# Altium schematic sheet Sheet4.SchDoc
size A1; SheetNumber: 1; SheetTotal: 1
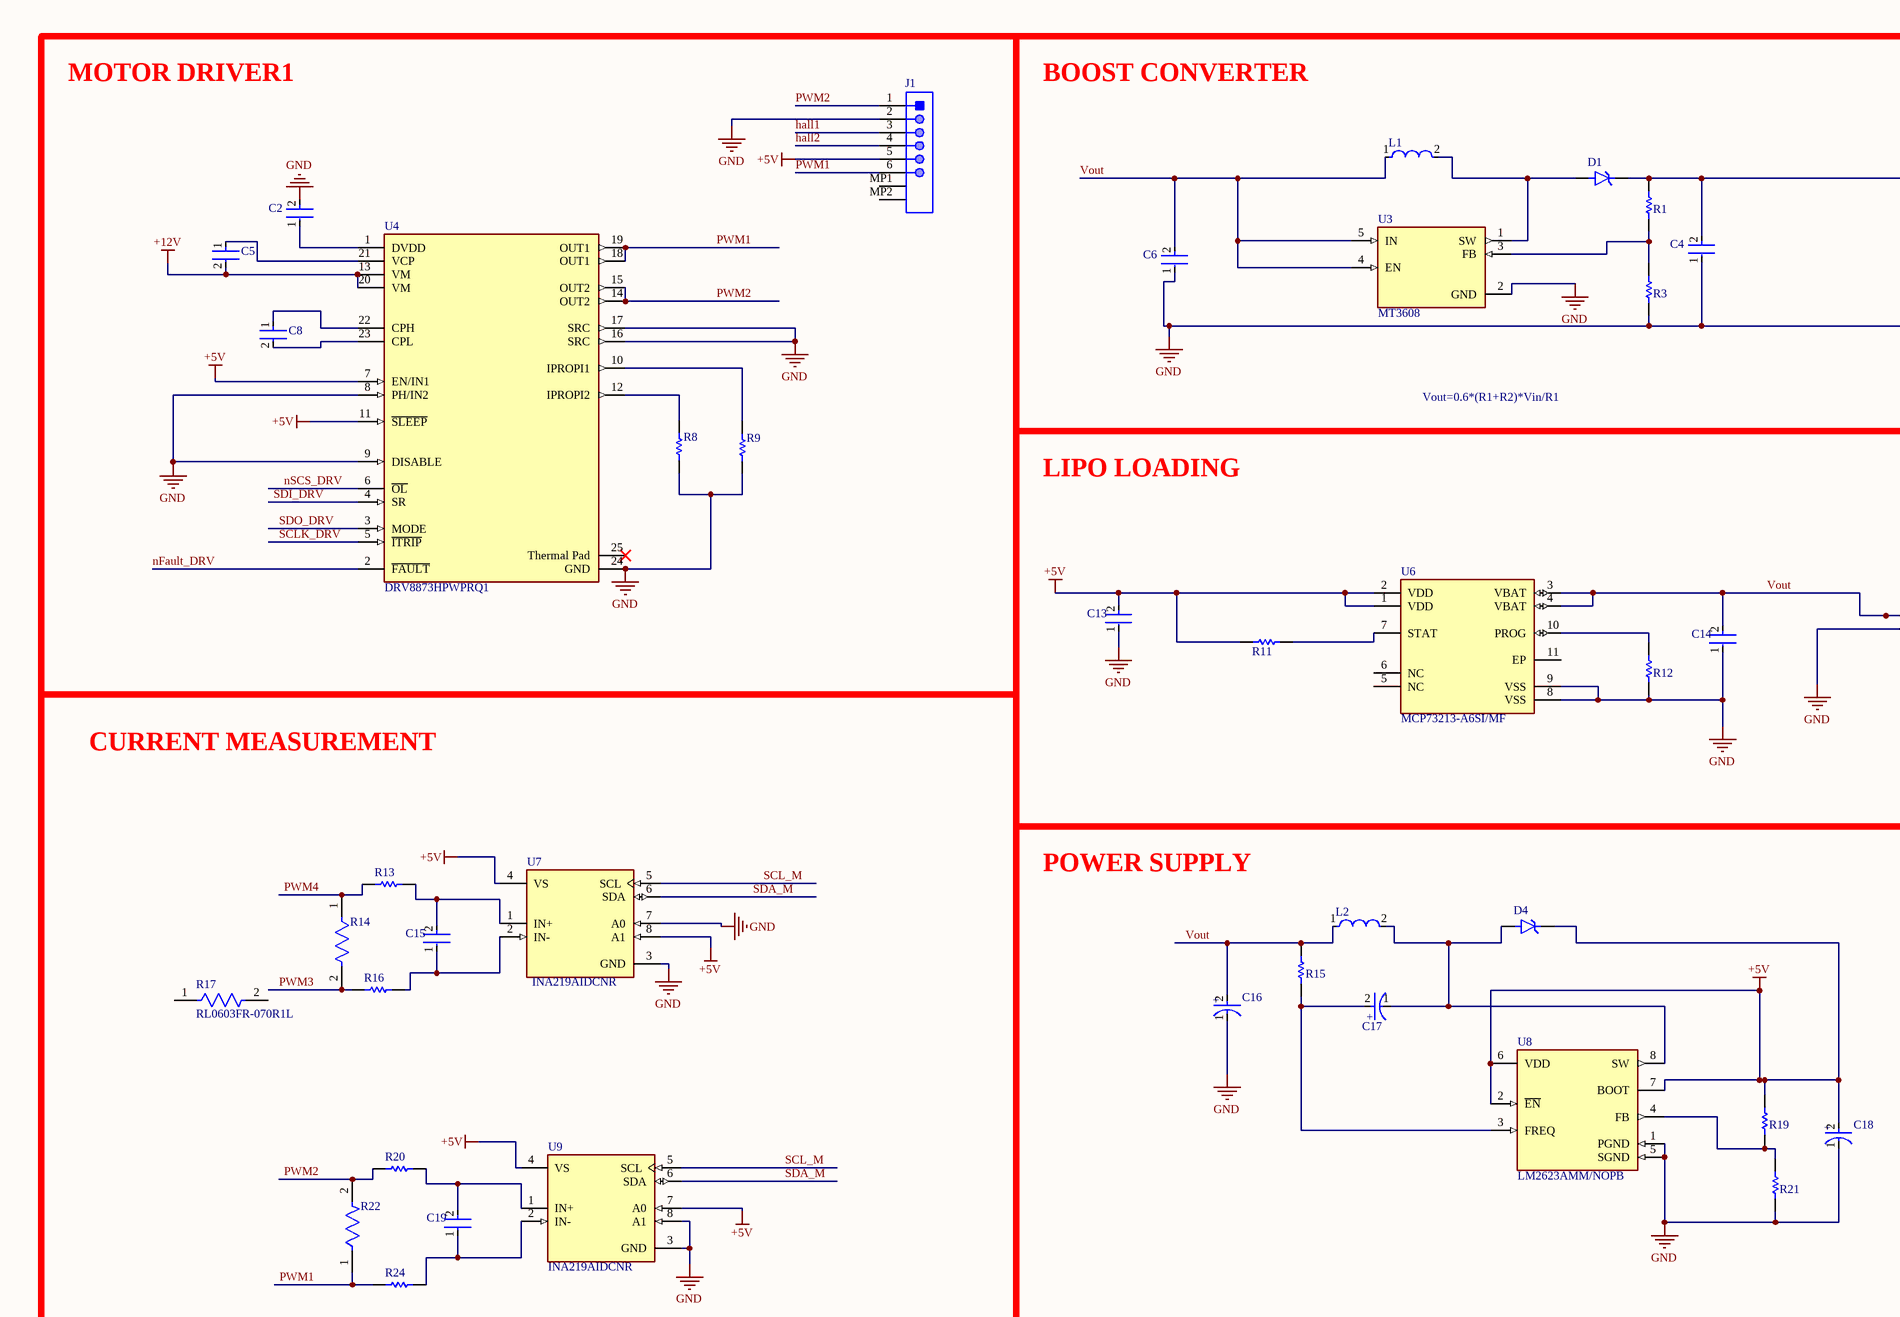
[diagram p0: Sheet4.SchDoc, top left]
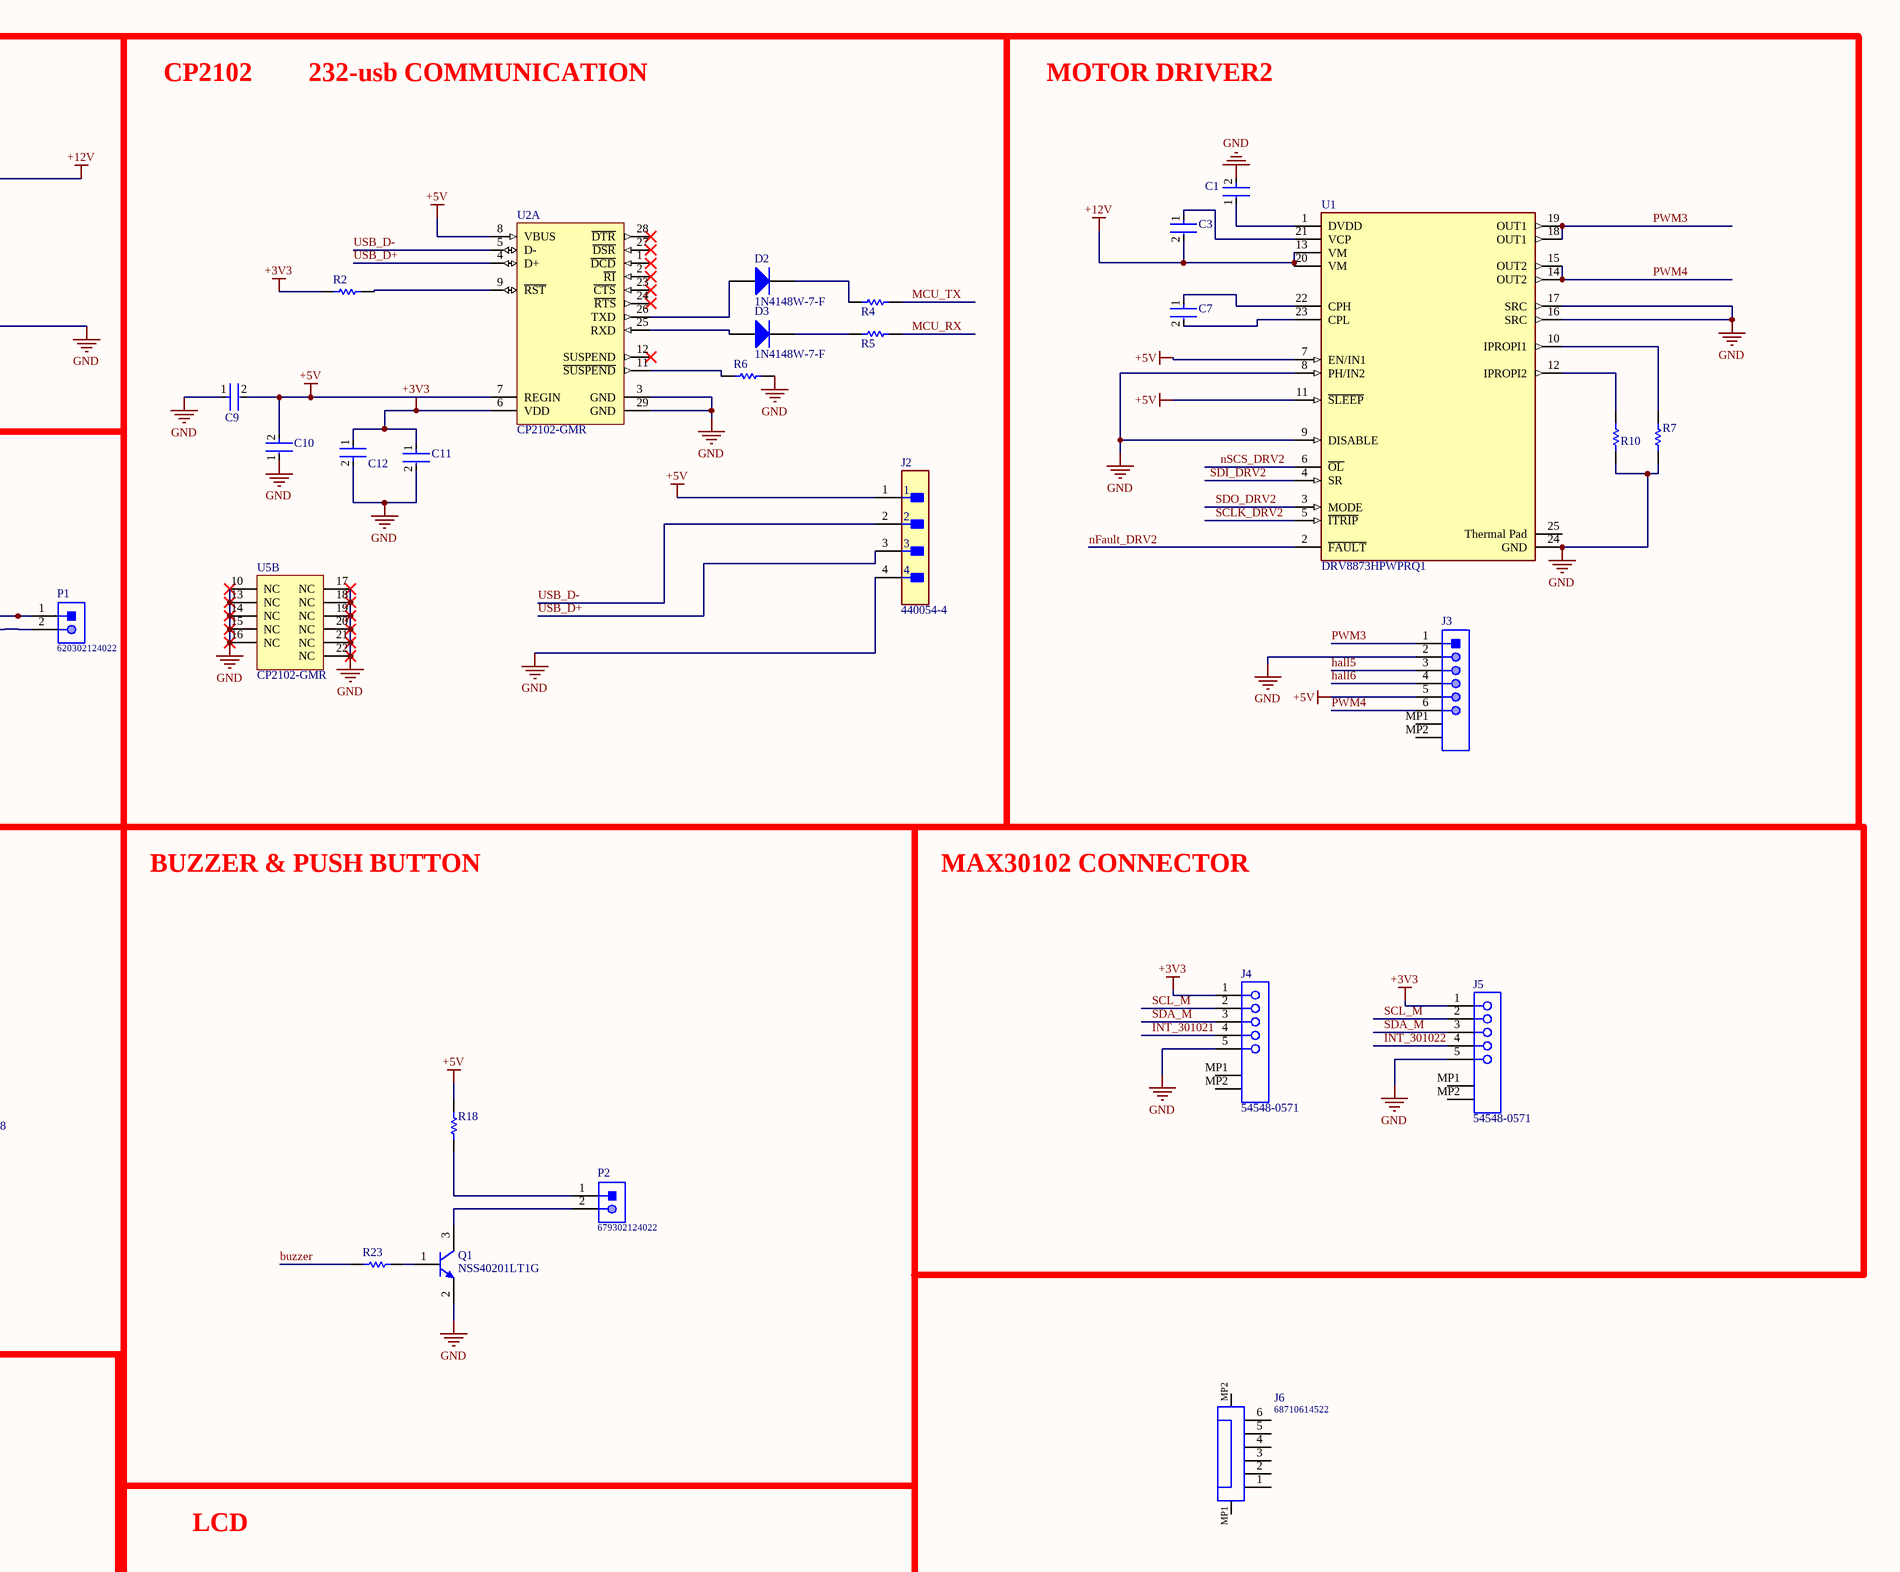
[diagram p1: Sheet4.SchDoc, top right]
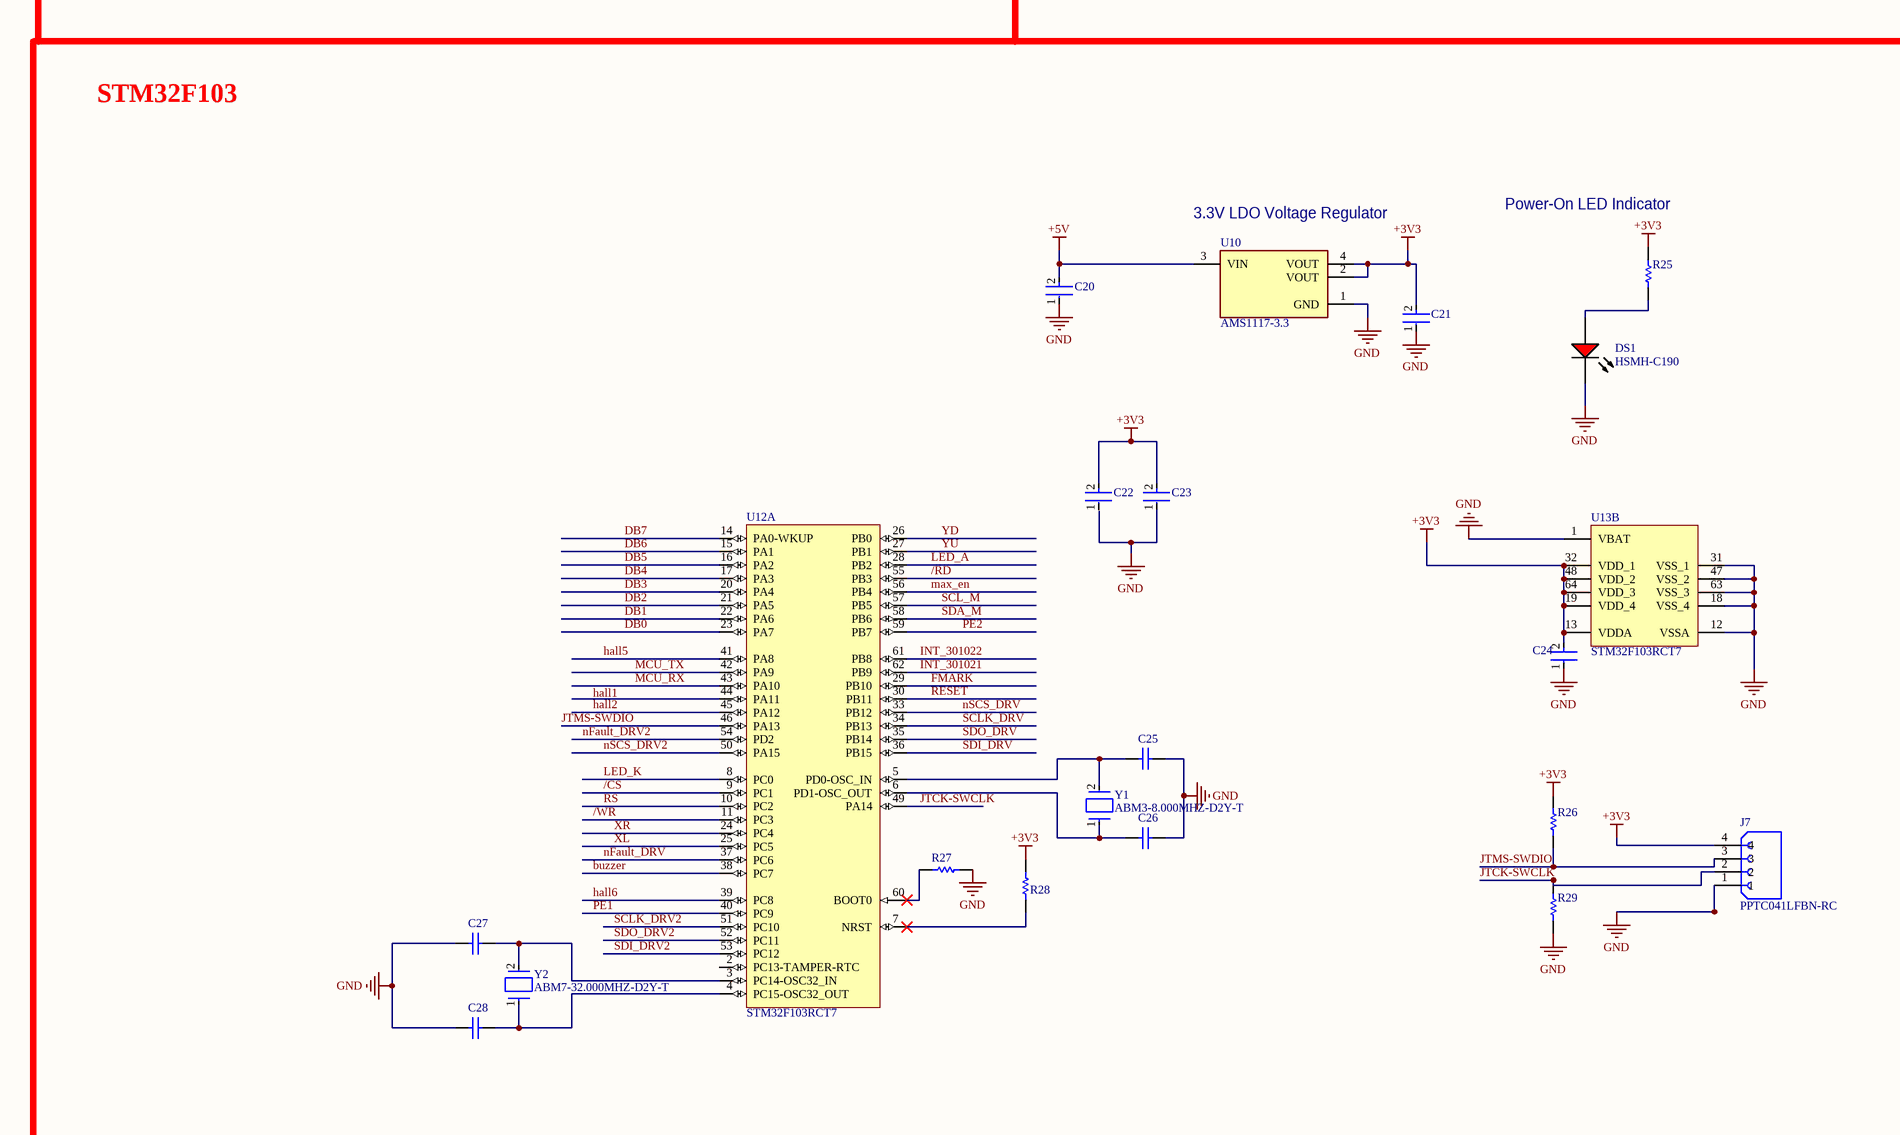
[diagram p2: Sheet4.SchDoc, bottom left]
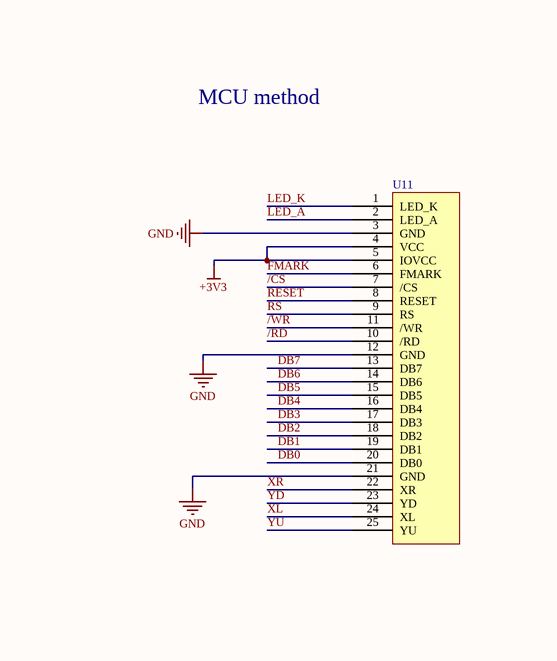
[diagram p3: Sheet4.SchDoc, bottom right]

## Parts
C1  GRM155R71C104KA88D  [FP-GRM15-MFG]  (value not drawn)
C2  GRM155R71C104KA88D  [FP-GRM15-MFG]  (value not drawn)
C3  GRM155R61A105KE15D  [FP-GRM15-0_1-MFG]  (value not drawn)
C4  GRM155R71C104KA88D  [FP-GRM15-MFG]  (value not drawn)
C5  GRM155R61A105KE15D  [FP-GRM15-0_1-MFG]  (value not drawn)
C6  GRM155R71C104KA88D  [FP-GRM15-MFG]  (value not drawn)
C7  GRM155R71E473KA88D  [FP-GRM155-0_05-IPC_C]  (value not drawn)
C8  GRM155R71E473KA88D  [FP-GRM155-0_05-IPC_C]  (value not drawn)
C9  GRM155R71E473KA88D  [FP-GRM155-0_05-IPC_C]  (value not drawn)
C10  GRM155R71C104KA88D  [FP-GRM15-MFG]  (value not drawn)
C11  GRM155R71E473KA88D  [FP-GRM155-0_05-IPC_C]  (value not drawn)
C12  GRM155R71C104KA88D  [FP-GRM15-MFG]  (value not drawn)
C13  GRM155R71C104KA88D  [FP-GRM15-MFG]  (value not drawn)
C14  GRM155R71C104KA88D  [FP-GRM15-MFG]  (value not drawn)
C15  GRM155R71C104KA88D  [FP-GRM15-MFG]  (value not drawn)
C16  TAJB336K010RNJ  [FP-TAJB-MFG]  (value not drawn)
C17  TAJB336K010RNJ  [FP-TAJB-MFG]  (value not drawn)
C18  TAJB336K010RNJ  [FP-TAJB-MFG]  (value not drawn)
C19  GRM155R71C104KA88D  [FP-GRM15-MFG]  (value not drawn)
C20  GRM155R71C104KA88D  [FP-GRM15-MFG]  (value not drawn)
C21  GRM155R71C104KA88D  [FP-GRM15-MFG]  (value not drawn)
C22  GRM155R71C104KA88D  [FP-GRM15-MFG]  (value not drawn)
C23  GRM155R71C104KA88D  [FP-GRM15-MFG]  (value not drawn)
C24  GRM155R71C104KA88D  [FP-GRM15-MFG]  (value not drawn)
C25  CC0402JRNPO9BN220  [CAPC1005X55X25ML05T05]  (value not drawn)
C26  CC0402JRNPO9BN220  [CAPC1005X55X25ML05T05]  (value not drawn)
C27  CC0402JRNPO9BN220  [CAPC1005X55X25ML05T05]  (value not drawn)
C28  CC0402JRNPO9BN220  [CAPC1005X55X25ML05T05]  (value not drawn)
D1  1SMB5918BT3G  [DIOM5226X220N]  (value not drawn)
D2  1N4148W-7-F  [DIOD-SOD123-2_V]
D3  1N4148W-7-F  [DIOD-SOD123-2_V]
D4  1SMB5918BT3G  [DIOM5226X220N]  (value not drawn)
DS1  HSMH-C190  [AVAG-HSMX-C190_V]
J1  S6B-PH-SM4-TB(LF)(SN)  [JST-S6B-PH-SM4-TB(LF)(SN)_V]  (value not drawn)
J2  440054-4  [FP-440054-4-MFG]
J3  S6B-PH-SM4-TB(LF)(SN)  [JST-S6B-PH-SM4-TB(LF)(SN)_V]  (value not drawn)
J4  54548-0571  [MOLX-54548-0571]
J5  54548-0571  [MOLX-54548-0571]
J6  68710614522  [68710614522]
J7  PPTC041LFBN-RC  [SULLINS_PPTC041LFBN-RC]
L1  LB3218T220K  [FP-LB3218-1_8-0_2-IPC_A]  (value not drawn)
L2  LB3218T220K  [FP-LB3218-1_8-0_2-IPC_A]  (value not drawn)
P1  620302124022  [620302124022]
P2  679302124022  [679302124022]
Q1  NSS40201LT1G  [ONSC-SOT-23-3-318-08_V]
R1  RC0402FR-075K1L  [RESC1005X40X25NL05T10]  (value not drawn)
R2  CRCW08055K00FKTA  [RESC2013X50X30NL20T20]  (value not drawn)
R3  RC0603FR-072K7L  [RESC1608X55X25LL10T15]  (value not drawn)
R4  ERJ-3EKF3300V  [RESC1608X55X30ML15T15]  (value not drawn)
R5  ERJ-3EKF3300V  [RESC1608X55X30ML15T15]  (value not drawn)
R6  CRCW08055K00FKTA  [RESC2013X50X30NL20T20]  (value not drawn)
R7  ERJ-3EKF1501V  [RESC1608X55X30ML15T15]  (value not drawn)
R8  ERJ-3EKF1501V  [RESC1608X55X30ML15T15]  (value not drawn)
R9  ERJ-3EKF1501V  [RESC1608X55X30ML15T15]  (value not drawn)
R10  ERJ-3EKF1501V  [RESC1608X55X30ML15T15]  (value not drawn)
R11  MCMR04X300 JTL  [RESC1005X40X25ML05T10]  (value not drawn)
R12  CRCW06036K20JNEA  [RESC1609X50X30LL10T20]  (value not drawn)
R13  TNPW080510R0FEEA  [RESC2013X55X40ML15T20]  (value not drawn)
R14  RL0603FR-070R1L  [FP-RL0603-0_55-MFG]  (value not drawn)
R15  MCMR04X300 JTL  [RESC1005X40X25ML05T10]  (value not drawn)
R16  TNPW080510R0FEEA  [RESC2013X55X40ML15T20]  (value not drawn)
R17  RL0603FR-070R1L  [FP-RL0603-0_55-MFG]
R18  ERJ-3EKF3300V  [RESC1608X55X30ML15T15]  (value not drawn)
R19  CRCW0603300KFKEA  [RESC1609X50X30NL10T20]  (value not drawn)
R20  TNPW080510R0FEEA  [RESC2013X55X40ML15T20]  (value not drawn)
R21  ERJ-3EKF1003V  [RESC1608X55X30ML15T15]  (value not drawn)
R22  RL0603FR-070R1L  [FP-RL0603-0_55-MFG]  (value not drawn)
R23  RC0603FR-07100RL  [RESC1608X55X25ML10T15]  (value not drawn)
R24  TNPW080510R0FEEA  [RESC2013X55X40ML15T20]  (value not drawn)
R25  ERJ-3EKF3300V  [RESC1608X55X30ML15T15]  (value not drawn)
R26  ERJ3EKF1002V  [RESC1609X55X30LL15T15]  (value not drawn)
R27  ERJ3EKF1002V  [RESC1609X55X30LL15T15]  (value not drawn)
R28  MCMR04X300 JTL  [RESC1005X40X25ML05T10]  (value not drawn)
R29  ERJ3EKF1002V  [RESC1609X55X30LL15T15]  (value not drawn)
U1  DRV8873HPWPRQ1  [FP-PWP0024J-MFG]
U2  CP2102-GMR  [SLAB-QFN-28-3125x3125TP_M]  (part A of 2)
U3  MT3608  [SOT95P280X145-6N]
U4  DRV8873HPWPRQ1  [FP-PWP0024J-MFG]
U5  CP2102-GMR  [SLAB-QFN-28-3125x3125TP_M]  (part B of 2)
U6  MCP73213-A6SI/MF  [FP-C04-063-IPC_B]
U7  INA219AIDCNR  [FP-DCN0008A-IPC_B]
U8  LM2623AMM/NOPB  [FP-DGK0008A-IPC_B]
U9  INA219AIDCNR  [FP-DCN0008A-IPC_B]
U10  AMS1117-3.3  [SOT229P700X180-4N]
U11  (no value)  [25pin 0.3mm connector]
U12  STM32F103RCT7  [STM-LQFP64_M]  (part A of 2)
U13  STM32F103RCT7  [STM-LQFP64_M]  (part B of 2)
Y1  ABM3-8.000MHZ-D2Y-T  [FP-ABM3-MFG]
Y2  ABM7-32.000MHZ-D2Y-T  [FP-ABM7-MFG]

## Blocks framed on the sheet
MOTOR DRIVER1: C2 C5 C8 J1 R8 R9 U4
BOOST CONVERTER: C4 C6 D1 L1 R1 R3 U3
MOTOR DRIVER2: C1 C3 C7 J3 R7 R10 U1
LIPO LOADING: C13 C14 P1 R11 R12 U6
CURRENT MEASUREMENT: C15 C19 R13 R14 R16 R17 R20 R22 R24 U7 U9
POWER SUPPLY: C16-C18 D4 L2 R15 R19 R21 U8
BUZZER & PUSH BUTTON: P2 Q1 R18 R23
MAX30102 CONNECTOR: J4 J5
STM32F103: C20-C28 DS1 J7 R25-R29 U10 U12 U13 Y1 Y2
LCD: U11

## Nets
+3V3: C11.1 C12.1 C21.2 C22.2 C23.2 C24.2 J4.1 J5.1 J7.4 R2.1 R25.2 R28.2 U2.6(VDD) U10.2(VOUT) U10.4(VOUT) U11.4(VCC) U11.5(IOVCC) U13.13(VDDA) U13.19(VDD_4) U13.32(VDD_1) U13.48(VDD_2) U13.64(VDD_3)
+5V: C9.2 C10.2 C13.2 C18.2(A) C20.2 D4.C(K) J1.5 J2.1 J3.5 R11.2 R18.2 R19.2 U1.7(EN/IN1) U1.11(~{SLEEP}) U2.7(REGIN) U2.8(VBUS) U4.7(EN/IN1) U4.11(~{SLEEP}) U6.1(VDD) U6.2(VDD) U7.4(VS) U7.8(A1) U8.2(~{EN}) U8.6(VDD) U8.7(BOOT) U9.4(VS) U9.7(A0) U10.3(VIN)
+12V: C3.2 C4.2 C5.2 D1.C(K) R1.2 U1.13(VM) U1.20(VM) U4.13(VM) U4.20(VM)
GND: C1.2 C2.2 C4.1 C6.1 C9.1 C10.1 C11.2 C12.2 C13.1 C14.1 C16.1(C) C18.1(C) C20.1 C21.1 C23.1 C24.1 C25.2 C26.2 C27.1 C28.1 DS1.2(K) J1.2 J2.4 J3.2 J4.5 J5.5 J7.1 P1.2 Q1.2(E) R3.1 R6.2 R7.1 R8.1 R9.1 R10.1 R12.1 R21.1 R27.2 R29.1 U1.8(PH/IN2) U1.9(DISABLE) U1.16(SRC) U1.17(SRC) U1.24(GND) U2.3(GND) U2.29(GND) U3.2(GND) U4.8(PH/IN2) U4.9(DISABLE) U4.16(SRC) U4.17(SRC) U4.24(GND) U5.10(NC) U5.13(NC) U5.14(NC) U5.15(NC) U5.16(NC) U5.17(NC) U5.18(NC) U5.19(NC) U5.20(NC) U5.21(NC) U5.22(NC) U6.8(VSS) U6.9(VSS) U7.3(GND) U7.7(A0) U8.1(PGND) U8.5(SGND) U9.3(GND) U9.8(A1) U10.1(GND) U11.3(GND) U11.12(GND) U11.21(GND) U13.1(VBAT) U13.12(VSSA) U13.18(VSS_4) U13.31(VSS_1) U13.47(VSS_2) U13.63(VSS_3)
/CS: U11.7(/CS) U12.9(PC1)
/RD: U11.10(/RD) U12.55(PB3)
/WR: U11.11(/WR) U12.11(PC3)
buzzer: R23.1 U12.38(PC7)
DB0: U11.20(DB0) U12.23(PA7)
DB1: U11.19(DB1) U12.22(PA6)
DB2: U11.18(DB2) U12.21(PA5)
DB3: U11.17(DB3) U12.20(PA4)
DB4: U11.16(DB4) U12.17(PA3)
DB5: U11.15(DB5) U12.16(PA2)
DB6: U11.14(DB6) U12.15(PA1)
DB7: U11.13(DB7) U12.14(PA0-WKUP)
FMARK: U11.6(FMARK) U12.29(PB10)
hall1: J1.3
hall2: J1.4 U12.45(PA12)
hall5: J3.3 U12.41(PA8)
hall6: J3.4 U12.39(PC8)
INT_301021: J4.4 U12.62(PB9)
INT_301022: J5.4 U12.61(PB8)
JTCK-SWCLK: J7.2 R29.2 U12.49(PA14)
JTMS-SWDIO: J7.3 R26.1 U12.46(PA13)
LED_A: U11.2(LED_A) U12.28(PB2)
LED_K: U11.1(LED_K) U12.8(PC0)
max_en: U12.56(PB4)
MCU_RX: R5.1 U12.43(PA10)
MCU_TX: R4.1 U12.42(PA9)
nFault_DRV: U4.2(~{FAULT}) U12.37(PC6)
nFault_DRV2: U1.2(~{FAULT}) U12.54(PD2)
nSCS_DRV: U4.6(~{OL}) U12.33(PB12)
nSCS_DRV2: U1.6(~{OL}) U12.50(PA15)
PE1: U12.40(PC9)
PE2: U12.59(PB7)
PWM1: J1.6 R22.1 R24.1 U4.18(OUT1) U4.19(OUT1)
PWM2: J1.1 R20.1 R22.2 U4.14(OUT2) U4.15(OUT2)
PWM3: J3.1 R14.2 R16.1 U1.18(OUT1) U1.19(OUT1)
PWM4: J3.6 R13.1 R14.1 U1.14(OUT2) U1.15(OUT2)
RESET: U11.8(RESET) U12.30(PB11)
RS: U11.9(RS) U12.10(PC2)
SCL_M: J4.2 J5.2 U7.5(SCL) U9.5(SCL) U12.57(PB5)
SCLK_DRV: U4.5(~{ITRIP}) U12.34(PB13)
SCLK_DRV2: U1.5(~{ITRIP}) U12.51(PC10)
SDA_M: J4.3 J5.3 U7.6(SDA) U9.6(SDA) U12.58(PB6)
SDI_DRV: U4.4(SR) U12.36(PB15)
SDI_DRV2: U1.4(SR) U12.53(PC12)
SDO_DRV: U4.3(MODE) U12.35(PB14)
SDO_DRV2: U1.3(MODE) U12.52(PC11)
USB_D+: J2.3 U2.4(D+)
USB_D-: J2.2 U2.5(D-)
Vout: C6.2 C14.2 C16.2(A) L1.1 L2.1 P1.1 R15.2 U3.4(EN) U3.5(IN) U6.3(VBAT) U6.4(VBAT)
XL: U11.24(XL) U12.25(PC5)
XR: U11.22(XR) U12.24(PC4)
YD: U11.23(YD) U12.26(PB0)
YU: U11.25(YU) U12.27(PB1)
NetC1_1: C1.1 U1.1(DVDD)
NetC2_1: C2.1 U4.1(DVDD)
NetC3_1: C3.1 U1.21(VCP)
NetC5_1: C5.1 U4.21(VCP)
NetC7_1: C7.1 U1.22(CPH)
NetC7_2: C7.2 U1.23(CPL)
NetC8_1: C8.1 U4.22(CPH)
NetC8_2: C8.2 U4.23(CPL)
NetC15_1: C15.1 R16.2 U7.2(IN-)
NetC15_2: C15.2 R13.2 U7.1(IN+)
NetC17_1: C17.1(C) D4.A L2.2 U8.8(SW)
NetC17_2: C17.2(A) R15.1 U8.3(FREQ)
NetC19_1: C19.1 R24.2 U9.2(IN-)
NetC19_2: C19.2 R20.2 U9.1(IN+)
NetC25_1: C25.1 U12.5(PD0-OSC_IN) Y1.2
NetC26_1: C26.1 U12.6(PD1-OSC_OUT) Y1.1
NetC27_2: C27.2 U12.3(PC14-OSC32_IN) Y2.2
NetC28_2: C28.2 U12.4(PC15-OSC32_OUT) Y2.1
NetD1_A: D1.A L1.2 U3.1(SW)
NetD2_1: D2.1(A) U2.26(TXD)
NetD2_2: D2.2(K) R4.2
NetD3_1: D3.1(A) U2.25(RXD)
NetD3_2: D3.2(K) R5.2
NetDS1_1: DS1.1(A) R25.1
NetP2_1: P2.1 R18.1
NetP2_2: P2.2 Q1.3(C)
NetQ1_1: Q1.1(B) R23.2
NetR1_1: R1.1 R3.2 U3.3(FB)
NetR2_2: R2.2 U2.9(~{RST})
NetR6_1: R6.1 U2.11(~{SUSPEND})
NetR7_2: R7.2 U1.10(IPROPI1)
NetR8_2: R8.2 U4.12(IPROPI2)
NetR9_2: R9.2 U4.10(IPROPI1)
NetR10_2: R10.2 U1.12(IPROPI2)
NetR11_1: R11.1 U6.7(STAT)
NetR12_2: R12.2 U6.10(PROG)
NetR19_1: R19.1 R21.2 U8.4(FB)
NetR27_1: R27.1 U12.60(BOOT0)
NetR28_1: R28.1 U12.7(NRST)

Not connected (* = marked no-connect by the designer): C22 1; J1 MP1 MP2; J3 MP1 MP2; J4 MP1 MP2; J5 MP1 MP2; J6 1 2 3 4 5 6 MP1 MP2; R17 1 2; R26 2; U1 25(Thermal_Pad); U2 1(~{DCD})* 2(~{RI})* 12(SUSPEND)* 23(~{CTS})* 24(~{RTS})* 27(~{DSR})* 28(~{DTR})*; U4 25(Thermal_Pad)*; U6 5(NC) 6(NC) 11(EP); U12 2(PC13-TAMPER-RTC) 44(PA11)

## Notes on the sheet
- CP2102
- 232-usb COMMUNICATION
- Vout=0.6*(R1+R2)*Vin/R1
- (near U10) 3.3V LDO Voltage Regulator
- (near R25) Power-On LED Indicator
- MCU method
- Labels drawn without touching a wire or pin: +3V3, hall1
- (in symbol CMP-04424-000596-1) +

## Library data of the parts
C1 C2 C4 C6 C10 C12-C15 C19-C24 = CMP-2100-03641-2: CAP CER 0.1UF 16V X7R 0402; Manufacturer: Murata; Standoff Height: 0mm; Tolerance: 10%; Voltage Rating: 16Vdc; Material: Ceramic; Capacitance: 0.10μF; Value: 0.10μF; RoHS: TRUE; Manufacturer Part Number: GRM155R71C104KA88D; Temperature Characteristic: X7R; Octopart: https://octopart.com/grm155r71c104ka88d-murata-196880; Digikey Description: CAP CER 0.1UF 16V X7R 0402; Device Class L3: Ceramic Capacitors; Height: 0.55mm; ComponentLink2Description: Datasheet; Temperature Range Low: -55°C; Ipc Land Pattern Name: CAPC10050X219; ComponentLink2URL: https://search.murata.co.jp/Ceramy/image/img/A01X/G101/ENG/GRM155R71H471KA01-01A.pdf; Device Class L1: Passive Components; Lead Free: yes; Category: Cap; Package: GRM15; Temperature: -55°C to +125°C; Device Class L2: Capacitors; Temperature Range High: +125°C; Mouser Description: 0402 0.1 uF 16V ±10 % Tolerance X7R SMT Multilayer Ceramic Capacitor
C3 C5 = CMP-2008-04556-2: CAP CER 1UF 10V X5R 0402; Manufacturer: Murata; Material: Ceramic; Tolerance: 10%; Temperature Coefficient: 15%; Octopart: https://octopart.com/grm155r61a105ke15d-murata-197442; Manufacturer Part Number: GRM155R61A105KE15D; Lead Free: Yes; ComponentLink2Description: Datasheet; Temperature: -55°C to +85°C; Temperature Range High: +85°C; Height: 0.55mm; Capacitance: 1uF; Ipc Land Pattern Name: CAPC10050X50; ComponentLink2URL: https://search.murata.co.jp/Ceramy/image/img/A01X/G101/ENG/GRM155R61A105KE15-01A.pdf; Temperature Range Low: -55°C; Device Class L2: Capacitors; Voltage Rating: 10V; RoHS: TRUE; Device Class L1: Passive Components; Device Class L3: Ceramic Capacitors; Temperature Characteristic: X5R; Mouser Description: 0402 1 uF 10 V ±10% Tolerance X5R Surface Mount Multilayer Ceramic Capacitor; Automotive: No; Package: GRM15-0.1; Digikey Description: CAP CER 1UF 10V X5R 0402; Value: 1uF; Category: Cap
C7-C9 C11 = CMP-2008-04630-5: Chip Multilayer Ceramic Capacitors for General Purpose, 0402, 47000pF, X7R, 15%, 10%, 25V; Capacitance: 47nF; Depth: 0.5mm; Case/Package: 0402; Tolerance: 10%; REACH SVHC: No SVHC; Termination: SMD/SMT; Number of Pins: 2; Mount: Surface Mount; Radiation Hardening: No; Height: 0.5mm; Min Operating Temperature: -55°C; Max Operating Temperature: 125°C; Thickness: 0.022inch; Length: 1mm; Voltage Rating (DC): 25V; Material: Ceramic; Lead Free: Lead Free; Packaging: Tape and Reel; Dielectric: X7R; Voltage: 25V; Case Code (Metric): 1005; Width: 0.02inch; Case Code (Imperial): 0402; Voltage Rating: 25V; Package Quantity: 1
C16 C18 = CMP-04424-000596-1: 22uF 10V  ±10% 1.8Ω 1210  SMD Tantalum Capacitor; Polarity: Polar; Leakage Current: 3.3uA; ESR (Equivalent Series Resistance): 1.8R; Dissipation Factor: 6%; Capacitance: 33uF; Tolerance: 10%; Length: 3.5mm; Number of Pins: 2; Case/Package: 1210; Dielectric Material: Tantalum; Depth: 2.8mm; Features: General Purpose; Voltage Rating: 10V; Series: TAJ; Mount: Surface Mount; Min Operating Temperature: -55°C; Voltage: 10V; Termination: SMD/SMT; Case Code (Imperial): 1210; Packaging: Tape and Reel; Package Quantity: 1; Construction: Flat; Height - Seated (Max): 0.083inch; Lead Free: Lead Free; Width: 2.8mm; Voltage Rating (DC): 10V; Height: 1.9mm; RoHS Compliant: Yes; REACH SVHC: No SVHC; Radiation Hardening: No; Lead Pitch: 1.4mm; Case Code (Metric): 3528; Max Operating Temperature: 125°C
C17 = CMP-04424-000596-1: 4.7uF 10V  ±10% 1.8Ω 1210  SMD Tantalum Capacitor; Polarity: Polar; Leakage Current: 3.3uA; ESR (Equivalent Series Resistance): 1.8R; Dissipation Factor: 6%; Capacitance: 33uF; Tolerance: 10%; Length: 3.5mm; Number of Pins: 2; Case/Package: 1210; Dielectric Material: Tantalum; Depth: 2.8mm; Features: General Purpose; Voltage Rating: 10V; Series: TAJ; Mount: Surface Mount; Min Operating Temperature: -55°C; Voltage: 10V; Termination: SMD/SMT; Case Code (Imperial): 1210; Packaging: Tape and Reel; Package Quantity: 1; Construction: Flat; Height - Seated (Max): 0.083inch; Lead Free: Lead Free; Width: 2.8mm; Voltage Rating (DC): 10V; Height: 1.9mm; RoHS Compliant: Yes; REACH SVHC: No SVHC; Radiation Hardening: No; Lead Pitch: 1.4mm; Case Code (Metric): 3528; Max Operating Temperature: 125°C
C25-C28 = CMP-2100-03590-1: Chip Capacitor, 22 pF, +/- 5%, 50 V, -55 to 125 degC, 0402 (1005 Metric), RoHS, Tape and Reel; Manufacturer: Yageo; Voltage Rating: 50V; Dielectric Material: Ceramic; Capacitance: 22pF; Temperature Coefficient: 30ppm/degC; Dielectric: C0G; Insulation Resistance: 100GR; Datasheet URL: http://www.yageo.com/NewPortal/yageodocoutput?fileName=/pdf/MLCC/UPY-GP_NP0_16V-to-50V_14.pdf; Depth: 0.5mm; Number of Pins: 2; Height: 0.5mm; Min Operating Temperature: -55degC; REACH SVHC: NoSVHC; Max Operating Temperature: 125degC; Voltage Rating (DC): 50V; Composition: Ceramic; Packaging: TapeandReel; Package Quantity: 1; Package Reference: 0402; Length: 1mm; Radiation Hardening: No; Package Description: 2-Pin Surface Mount Device, Body 1 x 0.5 mm; RoHSCompliant: True; Thickness: 0.022inch; Manufacturer URL: http://www.yageo.com/; Mount: SurfaceMount; Case Code (Metric): 1005; Case/Package: 0402; Tolerance: 5%; Termination: SMD/SMT; Width: 0.02inch; Datasheet Version: Rev. 14, 07/2016; Lead Free: LeadFree; Case Code (Imperial): 0402
D1 = 1SMB5918BT3G: Zener Diode 12.1V 3W Â±5% Surface Mount SMB; MF: ON Semiconductor; Value: *; Package: DO-214 ON Semiconductor; Price: None; Availability: Good; MP: 1SMB5918BT3G; Arrow_Electronics-Purchase-URL: https://snapeda.com/shop?store=Arrow+Electronics&id=475871; Mouser-Purchase-URL: https://snapeda.com/shop?store=Mouser&id=475871; SnapEDA_Link: https://www.snapeda.com/parts/1SMB5918BT3G/ON%20Semiconductor/view-part/475871/?ref=snap; DigiKey-Purchase-URL: https://snapeda.com/shop?store=DigiKey&id=475871
D2 D3 = CMP-2000-04932-2: Fast Switching Diode, 100 V, 0.15 A, -65 to 150 degC, 2-Pin?SOD123, RoHS, Tape and Reel; Recovery Time: 4ns; Brand: DiodesIncorporated; Unit Weight: 0.000353oz; Max Surge Current: 2A; Peak Reverse Voltage: 100V; Ir - Reverse Current: 1uA; Vf - Forward Voltage: 1.25V; Configuration: Single; If - Forward Current: 0.15A; Product Category: Diodes-GeneralPurpose,Power,Switching; Operating Temperature Range: -65Cto+150C; Packaging: Reel; Manufacturer URL: http://www.diodes.com/; Maximum Operating Temperature: +150C; Height: 1.25mm; Minimum Operating Temperature: -65C; Product: SwitchingDiodes; Package URL: http://www.diodes.com/datasheets/ds18004.pdf; Type: SwitchingDiode; Package Reference: SOD123-2; Width: 1.7mm; Datasheet URL: http://www.farnell.com/datasheets/1915529.pdf; Datasheet Version: Rev. 24-2, 10/2013; Series: 1N4148; Factory Pack Quantity: 3000; Length: 2.85mm; RoHS: True; Manufacturer: DiodesIncorporated; Mounting Style: SMD/SMT; Package / Case: SOD-123
D4 = 1SMB5918BT3G: Zener Diode 5.1V 3W Â±5% Surface Mount SMB; MF: ON Semiconductor; Value: *; Package: DO-214 ON Semiconductor; Price: None; Availability: Good; MP: 1SMB5918BT3G; Arrow_Electronics-Purchase-URL: https://snapeda.com/shop?store=Arrow+Electronics&id=475871; Mouser-Purchase-URL: https://snapeda.com/shop?store=Mouser&id=475871; SnapEDA_Link: https://www.snapeda.com/parts/1SMB5918BT3G/ON%20Semiconductor/view-part/475871/?ref=snap; DigiKey-Purchase-URL: https://snapeda.com/shop?store=DigiKey&id=475871
DS1 = CMP-1744-00004-1: LED Uni-Color Red, 65 mW, 20 mA, -40 to 85 degC, 2-Pin SMD, RoHS, Tape and Reel; Connector Type: USB; Gender: Male; Current Rating: 1 A; Length: 7.5 mm; Lead Pitch: 0.65 mm; PackageReference: HSMX-C190; Package Quantity: 2000; Max Operating Temperature: 85 degC; PackageDescription: 2-Pin Surface Mount Device, Body 1.6 x 0.8 mm, Height 0.9 mm; ComponentLink3Description: Package Specification; Mount: Surface Mount; Min Operating Temperature: -30 degC; ComponentLink3URL: http://www.fairchildsemi.com/dwg/MA/MA03D.pdf; ComponentLink1Description: Manufacturer URL; Contact Material: Copper; Pins: 5; Width: 5.6 mm; ComponentLink2Description: Datasheet; RoHSCompliant: true; DatasheetVersion: Mar-12; Height: 2.8 mm; Packaging: Tape and Reel; Contact Plating: Gold; ComponentLink1URL: http://www.avagotech.com/; REACH SVHC: No SVHC; ComponentLink2URL: http://docs.avagotech.com/docs/AV02-0551EN
J1 J3 = CMP-2000-07027-1: Male Header, Pitch 2 mm, 1 x 6 Position, Height 5.5 mm, -25 to 85 degC; Manufacturer: JST; Pitch: 2mm; Style/Orientation: RightAngleHeader/Plug; No of Positions: 6; Package Reference: S6B-PH-SM4-TB(LF)(SN); Type: ShroudedHeader; Package Description: Male Header, Pitch 2 mm, 1 x 6 Position, Height 5.5 mm; Mounting Technology: SurfaceMount; Datasheet Version: 11/2008; Termination: Solder; Datasheet URL: https://datasheet.ciiva.com/11747/0900766b80df0d9d-11747278.pdf; Manufacturer URL: http://www.jst.com/home2.html
J2 = CMP-03369-000004-1: CONN HEADER VERT 4POS 2MM; Manufacturer: TE; Current Rating: 3A; Conn Orientation: Vertical; Conn Gender: Male; Voltage Rating: 250V; Number Of Contacts: 4; Lead Free: Yes; Temperature Range High: +85°C; Package: 440054-4; Digikey Description: CONN HEADER VERT 4POS 2MM; Temperature: -25°C to +85°C; Pitch: 2mm; Device Class L2: Headers and Wire Housings; Number Of Rows: 1; Contact Material: Tin,Nickel; RoHS: TRUE; Device Class L3: unset; Temperature Range Low: -25°C; Device Class L1: Connectors; Height: 6.35mm; Footprint Url: https://www.te.com/commerce/DocumentDelivery/DDEController?Action=showdoc&DocId=Customer+Drawing%7F440054%7FF6%7Fpdf%7FEnglish%7FENG_CD_440054_F6.pdf%7F440054-4; Mouser Description: HPI Series; 2mm Pitch 4 Way 1 Row Straight PCB Header; Solder Termination; 3A; Manufacturer Part Number: 440054-4; Octopart: https://octopart.com/440054-4-te+connectivity-40072882; Automotive: No; ComponentLink2Description: Datasheet; Category: Conn; ComponentLink2URL: https://www.te.com/usa-en/product-440054-4.datasheet.pdf
J4 J5 = CMP-1241-00539-1: 0.5 mm Pitch Easy-On(TM) Type FPC Connector, 1.2 mm Mated Height, Right Angle, ZIF, SMT, Bottom Contact, 5 Circuits, -20 to 85 degC, ELV and RoHS Compliant, Tape and Reel; Manufacturer: Molex; PCB Locator: No; Entry Angle: 90degrees Angle; PCB Retention: Yes; Material - Plating Mating: Gold; Durability (mating cycles max): 20; Current (Max per Contact): 0.5A; Pitch - Mating Interface: 0.50mm; Voltage (Max): 50V; Material - Metal: Phosphor Bronze; Material - Plating Termination: Tin; Circuits (Loaded): 5; Mated Height: 1.20mm; ComponentLink1Description: Manufacturer URL; ComponentLink3Description: Package Specification; Number of Rows: 1; Stackable: No; ComponentLink2URL: http://www.molex.com/webdocs/datasheets/pdf/en-us/0545480571_FFC_FPC_CONNECTORS.pdf; Polarized to PCB: Yes; PartNumber: 54548-0571; ComponentLink3URL: http://www.molex.com/pdm_docs/sd/545480571_sd.pdf; PackageDescription: 5-Lead FPC Connector, Pitch 0.5 mm; Orientation: Right Angle; PackageVersion: Rev. N, 06/2008; PackageReference: 54548-0571; Contact Position: Bottom; Mounting Technology: Surface Mount; ComponentLink1URL: http://www.molex.com/molex/index.jsp; RoHS: TRUE; Packing: Tape and Reel; ComponentLink2Description: Datasheet
J6 = CMP-1502-01527-1: SMT ZIF Connectors WR-FPC, Horizontal, Bottom Contact, pitch 0.5 mm, 6 pins; Manufacturer: Wurth Elektronik; Pin Number: 6; Rated Current: 0.5A; Pitch: 0.5mm; Working Voltage: 50VAC; Withstanding Voltage: 250VAC; Contact Resistance: 20mOhm; Mounting Technology: SMT; Manufacturer URL: http://www.we-online.de; Operating Temperature: -25to85degC; Orientation: Horizontal; Packaging: TapeandReel; Contact Design: BottomContact; Datasheet URL: https://katalog.we-online.de/em/datasheet/68710614522.pdf; Package Reference: 68710614522; Publisher: WurthElektronik; Part Number: 68710614522
J7 = PPTC041LFBN-RC: 4 Position Header Connector 0.100 (2.54mm) Through Hole Tin; MF: Sullins Connector; Purchase-URL: https://pricing.snapeda.com/search/part/PPTC041LFBN-RC/?ref=eda; Check_prices: https://www.snapeda.com/parts/PPTC041LFBN-RC/Sullins+Connector+Solutions/view-part/?ref=eda; Package: None; SnapEDA_Link: https://www.snapeda.com/parts/PPTC041LFBN-RC/Sullins+Connector+Solutions/view-part/?ref=snap; Value: *; MP: PPTC041LFBN-RC; Digi-Key_Part_Number: S7002-ND
L1 L2 = CMP-14484-000643-1: SMD Inductors 22uH ±10% 0.255A 0.637Ω 1207; Test Frequency: 2.52MHz; Current Rating: 255mA; Shielding: Unshielded; Self Resonant Frequency: 19MHz; DC Resistance (DCR): 490mR; Core Material: Ferrite; Military Standard: Not; Min Operating Temperature: -40°C; Resistor Type: Wirewound; Termination: SMD/SMT; Mount: Surface Mount; Depth: 2mm; Package Quantity: 2000; Tolerance: 10%; Height: 1.8mm; Lead Free: Lead Free; Radiation Hardening: No; Case/Package: 1207; DC Current: 255mA; Series: LB; Inductance: 22uH; Width: 0.071inch; Case Code (Imperial): 1207; RoHS Compliant: Yes; Length: 3.2mm; Number of Pins: 2; Case Code (Metric): 3218; Height - Seated (Max): 0.08inch; Max DC Current: 255mA; Packaging: Tape and Reel; Max Operating Temperature: 105°C; Halogen Free: Halogen Free
P1 = CMP-1502-00660-1: Male Shrouded Header WR-WTB, SMT, Vertical, pitch 2 mm, 1 x 2 position; Manufacturer: Wurth Elektronik; Pitch: 2mm; Position: 1x2; Working Voltage: 100VAC; Contact Resistance: 20mOhm; Package Reference: 620302124022; Manufacturer URL: http://www.we-online.de; Gender: Male; Orientation: Vertical; Publisher: WurthElektronik; Mounting Technology: SMT; Operating Temperature: -25to85degC; Datasheet URL: https://katalog.we-online.de/em/datasheet/6203xx124022.pdf; Packaging: TapeandReel; Part Number: 620302124022
P2 = CMP-1502-00721-1: Male Shrouded Header WR-WTB, SMT, Vertical, pitch 1.5 mm, 1 x 2 position; Manufacturer: Wurth Elektronik; Contact Resistance: 20mOhm; Position: 1x2; Pitch: 1.5mm; Working Voltage: 50VAC; Orientation: Vertical; Publisher: WurthElektronik; Part Number: 679302124022; Gender: Male; Operating Temperature: -25to85degC; Datasheet URL: https://katalog.we-online.de/em/datasheet/6793xx124022.pdf; Mounting Technology: SMT; Packaging: TapeandReel; Package Reference: 679302124022; Manufacturer URL: http://www.we-online.de
Q1 = CMP-1048-00730-1: 40 V, 2 A, Low VCE(sat), NPN Transistor, 3-Pin SOT-23, Pb-Free, Tape and Reel; Manufacturer: On Semiconductor; IC Continuous (A): 2; fT Min (MHz): 150; PackageVersion: Rev. AP, 11/2009; ComponentLink1URL: http://www.onsemi.com/; PackageReference: SOT-23-3-318-08; Polarity: NPN; Mounting Technology: Surface Mount; ComponentLink3URL: http://www.onsemi.cn/pub_link/Collateral/318-08.PDF; RoHS: TRUE; ComponentLink1Description: Manufacturer URL; PackageDescription: 3-Pin Small Outline Transistor, Body 2.92 x 1.3 mm, Pitch 0.95 mm; DatasheetVersion: Rev. 8; ComponentLink2Description: Datasheet; PartNumber: NSS40201LT1G; ComponentLink2URL: http://www.onsemi.com/pub_link/Collateral/NSS40201L-D.PDF; Packing: Tape and Reel; ComponentLink3Description: Package Specification
R1 = CMP-2002-07753-1: Manufacturer: Yageo / Phycomp; Part Number: RC0402FR-075K1L
R2 R6 = CMP-2001-04239-1: Manufacturer: Vishay Dale; Part Number: CRCW08055K00FKTA
R3 = CMP-1012-00557-2: Chip Resistor, 2.7 KOhm, +/- 1%, 0.1 W, -55 to 155 degC, 0603 (1608 Metric), RoHS, Tape and Reel; Manufacturer: Yageo; Resistance: 2.7kOhms; Voltage Rating: 50V; Temperature Coefficient: 100PPM/C; Power Rating: 100mW; Mounting Technology: SurfaceMount; Case Code - mm: 1608; Datasheet URL: http://www.yageo.com/documents/recent/PYu-RC_Group_51_RoHS_L_7.pdf; Package Reference: 0603; Packaging: Reel; Termination Style: SMD/SMT; Manufacturer URL: http://www.yageo.com/; Case Code - in: 0603; Series: RC; Operating Temperature Range: -55Cto+155C; Datasheet Version: Rev. 7, 05/2017; Tolerance: 1%; Product: ThickFilmResistorsGeneralPurpose; Package Description: 2-Pin Surface Mount Device, Body 1.6 x 0.8 mm
R4 R5 R18 R25 = CMP-2000-00435-2: Chip Resistor, 330 Ohm, +/- 1%, 0.1 W, -55 to 155 degC, 0603 (1608 Metric), RoHS, Tape and Reel; Gender: Male; Mating Cycles: 10000; Current Rating: 500 mA; Voltage Rating: 10 V; REACH SVHC: No SVHC; PackageDescription: 2-Pin Surface Mount Device, Body 1.6 x 0.85 mm; Contact Finish: Gold; Pins: 8; ComponentLink1Description: Manufacturer URL; Packaging: Tape and Reel; Max Operating Temperature: 85 degC; Contact Material: Copper; Height: 1.45 mm; Width: 1.45 mm; DatasheetVersion: Apr-15; Package Quantity: 1500; Contact Plating: Gold; PackageReference: 0603; Mount: Surface Mount; Lead Pitch: 1.1 mm; Min Operating Temperature: -25 degC; ComponentLink1URL: http://www.panasonic.com/; ComponentLink2URL: http://industrial.panasonic.com/cdbs/www-data/pdf/RDA0000/AOA0000C86.pdf; Length: 13.7 mm; ComponentLink2Description: Datasheet; RoHSCompliant: true
R7-R10 = CMP-1012-00528-2: Manufacturer: Panasonic; Part Number: ERJ-3EKF1501V
R11 R15 R28 = CMP-2002-06669-1: 1.5K; Manufacturer: Multicomp; Part Number: MCMR04X300 JTL
R12 = CMP-1012-00093-2: Manufacturer: Vishay Dale; Part Number: CRCW06036K20JNEA
R13 R16 R20 R24 = CMP-2001-04719-1: Manufacturer: Vishay Dale; Part Number: TNPW080510R0FEEA
R14 R17 R22 = CMP-03412-037808-1: RES 0.1 OHM 1% 1/10W 0603; Voltage Rating: 50V; Temperature Coefficient: 800ppm/°C; Max Power Dissipation: 100mW; Resistance: 100mR; Case Code (Metric): 1608; Min Operating Temperature: -55°C; Radiation Hardening: No; Case/Package: 0603; Termination: SMD/SMT; Length: 1.6mm; Lead Free: Lead Free; Size Code: 0603; Construction: Rectangular; RoHS Compliant: Yes; Package Quantity: 1; Tolerance: 1%; Military Standard: Not; Height: 0.022inch; Contact Plating: Tin; Resistance Tolerance: 1%; Resistor Type: Thick Film; Technology: THICK FILM; Lead Pitch: 0.25mm; Series: RL; Number of Pins: 2; Width: 0.8mm; Packaging: Tape and Reel; Weight: 7.1E-05oz; Max Operating Temperature: 125°C; Features: Moisture Resistant; Number of Terminations: 2; Voltage Rating (DC): 50V; Case Code (Imperial): 0603; Depth: 0.8mm; Power Rating: 100mW
R19 = CMP-2000-03214-1: Manufacturer: Vishay Dale; Part Number: CRCW0603300KFKEA
R21 = CMP-2000-00182-1: Manufacturer: Panasonic; Part Number: ERJ-3EKF1003V
R23 = CMP-2100-03663-1: Chip Resistor, 100 Ohm, +/- 1%, 0.1 W, -55 to 155 degC, 0603 (1608 Metric), RoHS, Tape and Reel; Manufacturer: Yageo; Voltage Rating (DC): 50V; Power Rating: 100mW; Resistance: 100Ohm; Temperature Coefficient: 100ppm/degreesC; Number of Pins: 2; Tolerance: 1%; Height: 0.45mm; Manufacturer URL: http://www.yageo.com/; Military Standard: Not; Datasheet URL: http://www.yageo.com/NewPortal/yageodocoutput?fileName=/pdf/R-Chip/PYu-RC_Group_51_RoHS_L_5.pdf; Case Code (Imperial): 0603; Termination: SMD/SMT; Lead Free: LeadFree; Max Operating Temperature: 155degC; Case Code (Metric): 1608; RoHSCompliant: true; Voltage Rating: 50V; Width: 0.8mm; Composition: ThickFilm; Depth: 0.8mm; REACH SVHC: Unknown; Min Operating Temperature: -55degC; Packaging: TapeandReel; Package Description: 2-Pin Surface Mount Device, Body 1.6 x 0.8 mm; Length: 1.6mm; Package Reference: 0603; Datasheet Version: Rev. 5, 10/2016; Case/Package: 0603
R26 R27 R29 = CMP-1012-00623-3: Chip Resistor, 10 KOhm, +/- 1%, 0.1 W, -55 to 155 degC, 0603 (1608 Metric), RoHS, Tape and Reel; Manufacturer: Panasonic; Voltage Rating: 75V; Case\/Package: 0603; Power Rating: 100mW; Resistance: 10KOhm; Temperature Coefficient: 100ppm\/degreesC; Number of Pins: 2; Package Reference: 603; Depth: 0.8mm; Mount: SurfaceMount; Package Description: 2-Pin Surface Mount Device, Body 1.6 x 0.85 mm; Datasheet Version: 02/2017; Length: 1.6mm; Lead Free: LeadFree; Height: 0.45mm; Number of Terminations: 2; Max Power Dissipation: 100mW; Min Operating Temperature: -55degC; Datasheet URL: https://industrial.panasonic.com/cdbs/www-data/pdf/RDA0000/AOA0000C304.pdf; Termination: SMD/SMT; Case Code (Metric): 1608; Case Code (Imperial): 0603; Tolerance: 1%; Max Operating Temperature: 155degC; RoHSCompliant: true; Voltage Rating (DC): 75V; Radiation Hardening: No; Packaging: TapeandReel; Composition: ThickFilm; Mounting Technology: SurfaceMount; Manufacturer URL: http://www.panasonic.com/; Width: 0.031inch; REACH SVHC: NoSVHC; Contact Plating: Tin; Military Standard: Not; Package Quantity: 1
U1 U4 = CMP-04915-000006-1: IC MTRDRV UNIPLR 0-5.5V 24HTSSOP; Manufacturer: Texas Instruments; Max Supply Voltage: 38V; Number Of Outputs: 2; Standoff Height: 0.05mm; Max Junction Temp: +150°C; Switching Frequency: 400kHz; Nominal Supply Current: 5mA; Automotive Grade: Grade 1; Min Supply Voltage: 4.5V; Motor Type: Brushed; Output Current: 10A; Automotive: Yes; Device Class L2: Power Management ICs; Category: IC; Package: PWP0024J; Temperature Range Low: -40°C; Device Class L1: Integrated Circuits (ICs); Temperature: -40°C to +125°C; Octopart: https://octopart.com/drv8873hpwprq1-texas+instruments-94502234; Ipc Land Pattern Name: SOP65P640X120-24; Ambient Temperature Range High: +125°C; Temperature Range High: +125°C; Height: 1.2mm; Device Class L3: Motor Drivers; Lead Free: Yes; ComponentLink2URL: http://www.ti.com/lit/ds/symlink/drv8873-q1.pdf; Manufacturer Part Number: DRV8873HPWPRQ1; Digikey Description: IC MTRDRV UNIPLR 0-5.5V 24HTSSOP; Ambient Temperature Range Low: -40°C; ComponentLink2Description: Datasheet; RoHS: TRUE; Mouser Description: Automotive H-Bridge Motor Driver 24-HTSSOP -40 to 125
U2 U5 = CMP-2000-04924-1: Single-Chip USB to URAT Bridge, 3.3 V, -40 to 85 degC, 28-Pin QFN, RoHS, Tape and Reel; Manufacturer: Silicon Labs; Interface Circuit Standard 1: RS-232; Transmitter and Receiver FIFO Counter: No; Supply Current: 26mA; Operating Supply Voltage (Min): 3V; Operating Supply Voltage (Typ): 3.3V; Data Rate: 1000kbps; Operating Supply Voltage (Max): 3.6V; Number of Channels: 1; Package URL: http://www.silabs.com/Support%20Documents/TechnicalDocs/C8051T61x.pdf; Operating Temperature (Max): 85C; Datasheet URL: http://www.mouser.com/ds/2/368/CP2102-9-247052.pdf; Operating Temperature Classification: Industrial; Operating Temperature (Min): -40C; Package Description: 28-Pin Quad-Flat No-Leads Package, Body 5 x 5 mm, Pitch 0.5 mm; Manufacturer URL: http://www.silabs.com/; Rad Hardened: No; Package Reference: QFN-28; Pin Count: 28; Packaging: TapeandReel; Mounting: SurfaceMount; Package Type: QFNEP; Datasheet Version: Rev. 1.6, 12/2013
U3 = MT3608: High Efficiency 1.2MHz2A Step Up Converter; MF: Aerosemi Technology Co., Ltd; Price: None; Availability: Not in stock; Package: Package; MP: MT3608; Value: *; SnapEDA_Link: https://www.snapeda.com/parts/MT3608/Aerosemi+Technology+Co.%252C+Ltd/view-part/?ref=snap; Check_prices: https://www.snapeda.com/parts/MT3608/Aerosemi+Technology+Co.%252C+Ltd/view-part/?ref=eda
U6 = CMP-0133-00131-2: IC LI-ION/LI-POLY CTRLR 10-DFN; Number of Cells: 2; Max Input Voltage: 18V; Output Voltage: 8.4V; Max Supply Voltage: 13V; Operating Supply Current: 700uA; Drain to Source Resistance: 350mR; Max Output Current: 1.1A; Min Output Voltage: 8.15V; Voltage Rating: 8.85V; Min Supply Voltage: 4.2V; Radiation Hardening: No; Max Operating Temperature: 85°C; Mount: Surface Mount; Height: 0.037inch; REACH SVHC: No SVHC; Max Charge Current: 1.1A; Packaging: Rail/Tube; Number of Pins: 10; Package Quantity: 120; Case/Package: DFN; Max Output Voltage: 8.85V; Min Operating Temperature: -40°C; Length: 0.118inch; Number of Channels: 2; Width: 0.118inch; Lead Free: Lead Free
U7 U9 = CMP-0704-00041-3: IC CURRENT MONITOR 1% SOT23-8; Common Mode Rejection Ratio: 100dB; Bandwidth: 3.4MHz; Operating Supply Current: 1mA; Nominal Supply Current: 700uA; Min Input Voltage: 0V; Output Current per Channel: 10mA; Number of Amplifiers: 1; Input Offset Voltage (Vos): 100uV; Max Input Voltage: 26V; Min Supply Voltage: 3V; Max Supply Current: 5mA; Max Supply Voltage: 5.5V; Output Type: Digital; Accuracy: 1%; Radiation Hardening: No; Min Operating Temperature: -40°C; Contact Plating: Gold; REACH SVHC: No SVHC; Packaging: Tape and Reel; Max Operating Temperature: 125°C; Lead Free: Lead Free; Weight: 0.001411oz; Supply Current: 700uA; Number of Pins: 8; Length: 3mm; Quiescent Current: 700uA; Features: I²C; Height: 1.3mm; Output Current: 10mA; Case/Package: SOT-23-8; RoHS Compliant: Yes; Width: 1.75mm; Package Quantity: 3000; Series: Zero-Drift
U8 = CMP-0063-01233-4: IC REG BOOST ADJ 2.2A 8VSSOP; Switching Frequency: 2MHz; Max Input Voltage: 14V; Output Power: 500mW; Efficiency: 87%; Nominal Supply Current: 16mA; Min Input Voltage: 800mV; Output Type: Adjustable; Quiescent Current: 80uA; Number of Outputs: 1; Output Configuration: Positive; Synchronous Rectifier: No; Output Current: 2A; Min Output Voltage: 1.24V; Lead Free: Lead Free; Packaging: Tape and Reel; Weight: 0.004938oz; Height: 0.86mm; Number of Pins: 8; Topology: Boost; Length: 3mm; Min Operating Temperature: -40°C; Package Quantity: 1000; REACH SVHC: No SVHC; Mount: Surface Mount; Max Operating Temperature: 85°C; Min Supply Voltage: 800mV; Radiation Hardening: No; Max Output Current: 2A; Case/Package: MSOP; Output Voltage: 14V; Series: -; Max Output Voltage: 14V; Width: 3.1mm
U10 = LD1117: IC REG LINEAR 3.3V 800MA SOT223; Input Bias Current: 5mA; Output Voltage Accuracy: 1%; Dropout Voltage: 1.1V; Power Dissipation: 12W; Polarity: Positive; Min Input Voltage: 5.3V; Quiescent Current: 10mA; Max Output Current: 1.3A; Output Current: 950mA; Number of Regulators: 1; Max Supply Voltage: 15V; Output Type: Fixed; Output Voltage: 3.3V; Number of Terminals: 4; Min Supply Voltage: 3.3V; Termination: SMD/SMT; Mount: Surface Mount; Max Power Dissipation: 12W; Case/Package: SOT-223; Lead Free: Lead Free; Height: 1.8mm; REACH SVHC: No SVHC; Radiation Hardening: No; Width: 3.5mm; Length: 6.5mm; Packaging: Tape and Reel; Max Input Voltage: 15V; Accuracy: 1%; Weight: 0.01lb; Contact Plating: Tin; Max Operating Temperature: 125°C; Number of Pins: 4; Max Output Voltage: 3.3V; Min Operating Temperature: -40°C; Nominal Output Voltage: 3.3V; Package Quantity: 1; Min Output Voltage: 3.3V; Number of Outputs: 1
U11 = 25pin connector: 25PIN, FH26-25S-0.3SHW0(05). PITCH3MM
U12 U13 = CMP-0237-00207-3: ARM Cortex-M3 32-bit MCU, 256 KB Flash, 48 KB Internal RAM, 51 I/Os, 64-pin LQFP, -40 to 105 degC, Tray; D/A Converter: 2x12-bit (2 Channel); Internal RAM Size (kB): 48; I/Os (High Current): 51; Supply Voltage(Vcc) min (V): 2; Operating Frequency(F) (Processor speed) (MHz): 72; A/D Converter: 3x12-bit (16 Channel); FLASH Size (Prog) (kB): 256; ComponentLink3URL: http://www.st.com/st-web-ui/static/active/en/resource/technical/document/datasheet/DM00037051.pdf; Packing: Tray; Mounting Technology: Surface Mount; ComponentLink2URL: http://www.st.com/st-web-ui/static/active/en/resource/technical/document/datasheet/CD00191185.pdf; Core: ARM Cortex-M3; ComponentLink2Description: Datasheet; ComponentLink1URL: http://www.st.com/web/en/home.html; PartNumber: STM32F103RCT7; PackageVersion: Rev. 4, 06/2013; DatasheetVersion: Rev. 8; PackageReference: LQFP64; ComponentLink3Description: Package Specification; PackageDescription: 64-Pin Low Profile Quad Flat Package, 10 x 10 mm Body, 0.5 mm Pitch; ComponentLink1Description: Manufacturer URL
Y1 = CMP-2000-05033-2: Crystal 8MHz ±20ppm 18pF SMD-2 5mm x 3.2mm; Series Resistance: 500R; Frequency Stability: 30ppm; ESR (Equivalent Series Resistance): 140R; Load Capacitance: 18pF; Height: 0.051inch; Tolerance: 20ppm; Depth: 3.2mm; Max Operating Temperature: 85°C; Frequency: 8MHz; Termination: SMD/SMT; Lead Free: Lead Free; Number of Pins: 2; Width: 3.2mm; RoHS Compliant: Yes; Resistor Type: Ceramic; Length: 5mm; Mount: Surface Mount; Case/Package: CSMD; Package Quantity: 1000; Radiation Hardening: No; Min Operating Temperature: -40°C; Packaging: Tape and Reel; Frequency Tolerance: 20ppm
Y2 = CMP-27762-013665-1: Crystal 32MHz ±20ppm 18pF SMD-2 6mm x 3.5mm; ESR (Equivalent Series Resistance): 50R; Frequency Stability: 30ppm; Operating Frequency: 32 MHz; Termination: SMD/SMT; Packaging: Tape and Reel; Min Operating Temperature: -40°C; Lead Free: Lead Free; Series: ABM7; Load Capacitance: 18pF; Tolerance: 20ppm; Depth: 3.5mm; Frequency Tolerance: 20ppm; Number of Pins: 2; Radiation Hardening: No; Width: 3.3mm; Mount: Surface Mount; Height: 0.055inch; Max Operating Temperature: 85°C; Series Resistance: 50R; Package Quantity: 1000; Resistor Type: Ceramic; Length: 6mm; Frequency: 32MHz; Case/Package: CSMD